# Altium project Main_Board.PrjPcb (part 5 of 44)

## Sheet System_CLK.SchDoc: Dystrybutory zegarów
size A3; Organization: Altium Limited; Address1: L3, 12a Rodborough Rd; Address2: Frenchs Forest; Address3: NSW; Address4: Australia 2086
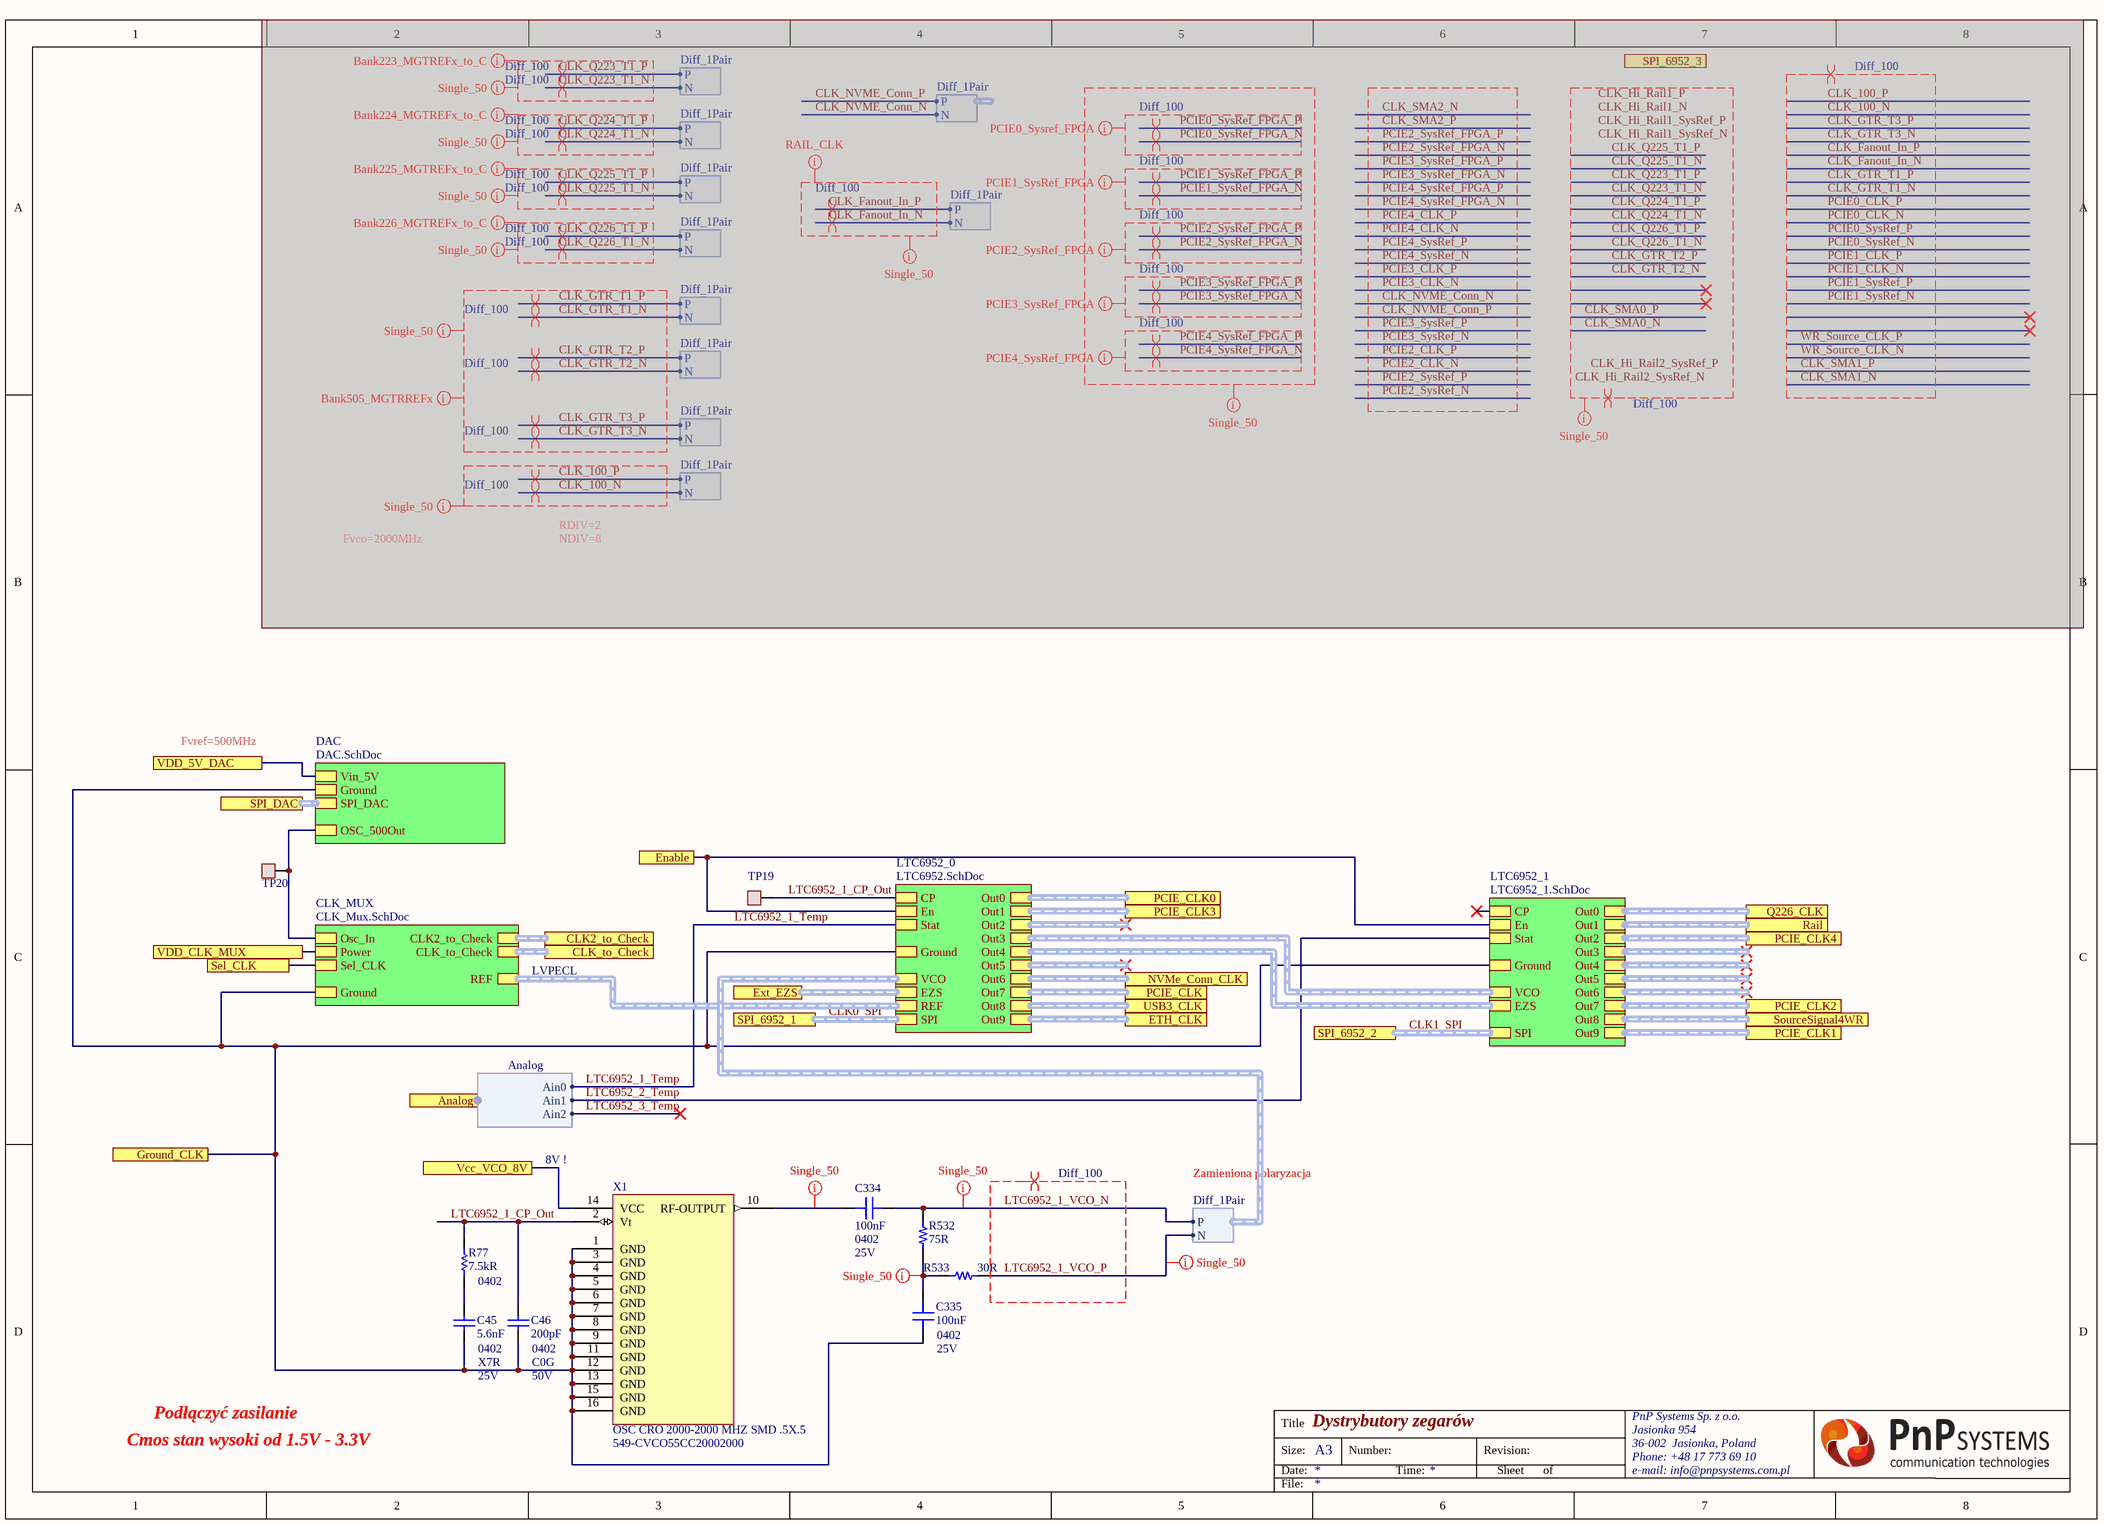
[diagram p5: System_CLK.SchDoc]

### Parts
C45  5.6nF  Case Code (Imperial): 0402  Voltage Rating: 25V  Dielectric: X7R  [CAP 0402/1005 KK]
C46  200pF  Case/Package: 0402  Voltage Rating: 50V  Dielectric: C0G  [CAP 0402/1005 KK]
C334  100nF  Case/Package: 0402  Voltage Rating: 25V  [CAP 0402/1005 KK]
C335  100nF  Case/Package: 0402  Voltage Rating: 25V  [CAP 0402/1005 KK]
R77  7.5kR  Case Code (Imperial): 0402  [RES 0402/1005 RF KK]
R532  75R  [RES 0402/1005 RF KK]
R533  30R  [RES 0402/1005 RF KK]
TP19  TestPoint  [TestPoint]  (value not drawn)
TP20  TestPoint  [TestPoint]  (value not drawn)
X1  OSC CRO 2000-2000 MHZ SMD .5X.5  Supplier Part Number 1: 549-CVCO55CC20002000  [CVCO55CW]

### Sub-sheets
CLK_MUX = CLK_Mux.SchDoc: Sel_CLK, REF (harness Diff_1Pair), Osc_In, Ground, Power, CLK_to_Check (harness Diff_1Pair), CLK2_to_Check (harness Diff_1Pair)
DAC = DAC.SchDoc: Vin_5V, SPI_DAC (harness SPI_H), Ground, OSC_500Out
LTC6952_0 = LTC6952.SchDoc: CP, Ground, Out6 (harness Diff_1Pair), VCO (harness Diff_1Pair), SPI (harness SPI_H), Stat, Out1 (harness Diff_1Pair), En, Out5 (harness Diff_1Pair), Out0 (harness Diff_1Pair), EZS (harness Diff_1Pair), Out2 (harness Diff_1Pair), Out7 (harness Diff_1Pair), REF (harness Diff_1Pair), Out8 (harness Diff_1Pair), Out3 (harness Diff_1Pair), Out4 (harness Diff_1Pair), Out9 (harness Diff_1Pair)
LTC6952_1 = LTC6952_1.SchDoc: EZS (harness Diff_1Pair), SPI (harness SPI_H), En, Out5 (harness Diff_1Pair), Ground, CP, Out4 (harness Diff_1Pair), Out6 (harness Diff_1Pair), VCO (harness Diff_1Pair), Out9 (harness Diff_1Pair), Stat, Out7 (harness Diff_1Pair), Out3 (harness Diff_1Pair), Out0 (harness Diff_1Pair), Out8 (harness Diff_1Pair), Out2 (harness Diff_1Pair), Out1 (harness Diff_1Pair)

### Ports
Analog (harness Analog), CLK2_to_Check (harness Diff_1Pair), CLK_to_Check (harness Diff_1Pair), Enable, ETH_CLK (harness Diff_1Pair), Ext_EZS (harness Diff_1Pair), Ground_CLK, NVMe_Conn_CLK (harness Diff_1Pair), PCIE_CLK0 (harness Diff_1Pair), PCIE_CLK1 (harness Diff_1Pair), PCIE_CLK2 (harness Diff_1Pair), PCIE_CLK3 (harness Diff_1Pair), PCIE_CLK4 (harness Diff_1Pair), PCIE_CLK (harness Diff_1Pair), Q226_CLK (harness Diff_1Pair), Rail (harness Diff_1Pair), Sel_CLK, SourceSignal4WR (harness Diff_1Pair), SPI_6952_1 (harness SPI_H), SPI_6952_2 (harness SPI_H), SPI_6952_3 (harness SPI_H), SPI_DAC (harness SPI_H), USB3_CLK (harness Diff_1Pair), Vcc_VCO_8V, VDD_5V_DAC, VDD_CLK_MUX

### Harnesses
Diff_1Pair: P, N
Analog: Ain0, Ain1, Ain2

### Nets
3V3_RAIL: port VDD_CLK_MUX, sheet CLK_MUX/Power
5V_LN: port VDD_5V_DAC, sheet DAC/Vin_5V
AGND: C45.1 C46.1 C335.1 X1.1(GND) X1.3(GND) X1.4(GND) X1.5(GND) X1.6(GND) X1.7(GND) X1.8(GND) X1.9(GND) X1.11(GND) X1.12(GND) X1.13(GND) X1.15(GND) X1.16(GND) ; port Ground_CLK, sheet DAC/Ground, sheet CLK_MUX/Ground, sheet LTC6952_1/Ground, sheet LTC6952_0/Ground
Enable_CLK: port Enable, sheet LTC6952_1/En, sheet LTC6952_0/En
LTC6952_1_CP_Out: C46.2 R77.2 TP19.1 X1.2(Vt) ; sheet LTC6952_0/CP
LTC6952_1_Temp: sheet LTC6952_0/Stat, port Analog.Ain0
LTC6952_1_VCO_N: C334.1 R532.2 ; sheet LTC6952_0/VCO.P
LTC6952_1_VCO_P: R533.2 ; sheet LTC6952_0/VCO.N
LTC6952_2_Temp: sheet LTC6952_1/Stat, port Analog.Ain1
OSC_500Out: TP20.1 ; sheet DAC/OSC_500Out, sheet CLK_MUX/Osc_In
SetClk_Si53323_2: port Sel_CLK, sheet CLK_MUX/Sel_CLK
NetC45_2: C45.2 R77.1
NetC334_2: C334.2 X1.10(RF-OUTPUT)
NetC335_2: C335.2 R532.1 R533.1
NetC713_2: X1.14(VCC) ; port Vcc_VCO_8V

### Buses and harness runs
harness CLK0_SPI = port SPI_6952_1 = sheet LTC6952_0/SPI
harness CLK1_SPI = port SPI_6952_2 = sheet LTC6952_1/SPI
harness port CLK2_to_Check = sheet CLK_MUX/CLK2_to_Check
harness port CLK_to_Check = sheet CLK_MUX/CLK_to_Check
harness port ETH_CLK = sheet LTC6952_0/Out9
harness port Ext_EZS = sheet LTC6952_0/EZS
harness port NVMe_Conn_CLK = sheet LTC6952_0/Out6
harness port PCIE_CLK0 = sheet LTC6952_0/Out0
harness port PCIE_CLK1 = sheet LTC6952_1/Out9
harness port PCIE_CLK2 = sheet LTC6952_1/Out7
harness port PCIE_CLK3 = sheet LTC6952_0/Out1
harness port PCIE_CLK4 = sheet LTC6952_1/Out2
harness port PCIE_CLK = sheet LTC6952_0/Out7
harness port Q226_CLK = sheet LTC6952_1/Out0
harness port Rail = sheet LTC6952_1/Out1
harness port SourceSignal4WR = sheet LTC6952_1/Out8
harness port SPI_DAC = sheet DAC/SPI_DAC
harness port USB3_CLK = sheet LTC6952_0/Out8
harness sheet CLK_MUX/REF = sheet LTC6952_0/REF
harness sheet LTC6952_0/Out3 = sheet LTC6952_1/VCO
harness sheet LTC6952_0/Out4 = sheet LTC6952_1/EZS

### Layout directives
net class Bank223_MGTREFx_to_C: CLK_Q223_T1_N, CLK_Q223_T1_P
net class Bank224_MGTREFx_to_C: CLK_Q224_T1_N, CLK_Q224_T1_P
net class Bank225_MGTREFx_to_C: CLK_Q225_T1_N, CLK_Q225_T1_P
net class Bank226_MGTREFx_to_C: CLK_Q226_T1_N, CLK_Q226_T1_P
differential pair; differential pair class Diff_100: CLK_100_N, CLK_100_P, CLK_Fanout_In_N, CLK_Fanout_In_P, CLK_GTR_T1_N, CLK_GTR_T1_P, CLK_GTR_T2_N, CLK_GTR_T2_P, CLK_GTR_T3_N, CLK_GTR_T3_P, CLK_Hi_Rail1_N, CLK_Hi_Rail1_P, CLK_Hi_Rail1_SysRef_N, CLK_Hi_Rail1_SysRef_P, CLK_Hi_Rail2_SysRef_N, CLK_Hi_Rail2_SysRef_P, CLK_Q223_T1_N, CLK_Q223_T1_P, CLK_Q224_T1_N, CLK_Q224_T1_P, CLK_Q225_T1_N, CLK_Q225_T1_P, CLK_Q226_T1_N, CLK_Q226_T1_P, CLK_SMA0_N, CLK_SMA0_P, CLK_SMA1_N, CLK_SMA1_P, LTC6952_1_VCO_N, LTC6952_1_VCO_P, PCIE0_CLK_N, PCIE0_CLK_P, PCIE0_SysRef_FPGA_N, PCIE0_SysRef_FPGA_P, PCIE0_SysRef_N, PCIE0_SysRef_P, PCIE1_CLK_N, PCIE1_CLK_P, PCIE1_SysRef_FPGA_N, PCIE1_SysRef_FPGA_P, PCIE1_SysRef_N, PCIE1_SysRef_P, PCIE2_SysRef_FPGA_N, PCIE2_SysRef_FPGA_P, PCIE3_SysRef_FPGA_N, PCIE3_SysRef_FPGA_P, PCIE4_SysRef_FPGA_N, PCIE4_SysRef_FPGA_P, WR_Source_CLK_N, WR_Source_CLK_P
net class Single_50: CLK_100_N, CLK_100_P, CLK_Fanout_In_N, CLK_Fanout_In_P, CLK_GTR_T1_N, CLK_GTR_T1_P, CLK_GTR_T2_N, CLK_GTR_T2_P, CLK_GTR_T3_N, CLK_GTR_T3_P, CLK_Hi_Rail1_N, CLK_Hi_Rail1_P, CLK_Hi_Rail1_SysRef_N, CLK_Hi_Rail1_SysRef_P, CLK_Hi_Rail2_SysRef_N, CLK_Hi_Rail2_SysRef_P, CLK_Q223_T1_N, CLK_Q223_T1_P, CLK_Q224_T1_N, CLK_Q224_T1_P, CLK_Q225_T1_N, CLK_Q225_T1_P, CLK_Q226_T1_N, CLK_Q226_T1_P, CLK_SMA0_N, CLK_SMA0_P, LTC6952_1_VCO_N, LTC6952_1_VCO_P, NetC334_2, NetC335_2, PCIE0_SysRef_FPGA_N, PCIE0_SysRef_FPGA_P, PCIE1_SysRef_FPGA_N, PCIE1_SysRef_FPGA_P, PCIE2_SysRef_FPGA_N, PCIE2_SysRef_FPGA_P, PCIE3_SysRef_FPGA_N, PCIE3_SysRef_FPGA_P, PCIE4_SysRef_FPGA_N, PCIE4_SysRef_FPGA_P
net class Bank505_MGTRREFx_: CLK_GTR_T1_N, CLK_GTR_T1_P, CLK_GTR_T2_N, CLK_GTR_T2_P, CLK_GTR_T3_N, CLK_GTR_T3_P
net class RAIL_CLK: CLK_Fanout_In_N, CLK_Fanout_In_P
net class PCIE0_Sysref_FPGA: PCIE0_SysRef_FPGA_N, PCIE0_SysRef_FPGA_P
net class PCIE1_SysRef_FPGA: PCIE1_SysRef_FPGA_N, PCIE1_SysRef_FPGA_P
net class PCIE2_SysRef_FPGA: PCIE2_SysRef_FPGA_N, PCIE2_SysRef_FPGA_P
net class PCIE3_SysRef_FPGA: PCIE3_SysRef_FPGA_N, PCIE3_SysRef_FPGA_P
net class PCIE4_SysRef_FPGA: PCIE4_SysRef_FPGA_N, PCIE4_SysRef_FPGA_P

### Notes on the sheet
- RDIV=2
- Fvco=2000MHz
- NDIV=8
- Fvref=500MHz
- LVPECL
- 8V !
- Zamieniona polaryzacja
- Cmos stan wysoki od 1.5V - 3.3V
- Podłączyć zasilanie
- Title
- Size:
- Date:
- A3
- Number:
- Time:
- Revision:
- Sheet
- of
- File:

### Library data of the parts
C45 = Capacitor: Cap Ceramic 0.0056uF 25V X7R 10% SMD 0402 125C Paper T/R; Manufacturer: Yageo; Manufacturer Part Number: CC0402KRX7R8BB562; Supplier 1: Digi-Key; Supplier Part Number 1: 311-1718-1-ND; RoHS: Yes; Category: Ceramic Capacitors; Stock 1: 38070; Pricing 1: 1=0,10000, 10=0,03300, 100=0,01470, 500=0,01050, 1000=0,00825, 2500=0,00750, 5000=0,00690 (USD); Mount: Surface Mount; Case/Package: 0402; Number of Pins: 2; Weight: 2.3E-05oz; Case Code (Metric): 1005; Min Operating Temperature: -55°C; Max Operating Temperature: 125°C; Capacitance: 5.6nF; Tolerance: 10%; Packaging: Tape and Reel; Voltage Rating (DC): 25V; Termination: SMD/SMT; Composition: Ceramic; Length: 0.039inch; Width: 0.02inch; Thickness: 0.022inch; Depth: 0.5mm; Lead Free: Lead Free; Halogen Free: Halogen Free; ComponentLink1URL: https://datasheet.ciiva.com/13264/upy-gphc-x7r-6-3v-to-50v-8-12304-13264955.pdf?src-supplier=Mouser; ComponentLink1Description: https://datasheet.ciiva.com/13264/upy-gphc-x7r-6-3v-to-50v-8-12304-13264955.pdf?src-supplier=Mouser
C46 = Capacitor: Multilayer Ceramic Capacitors MLCC - SMD/SMT 200pF 50V NPO 5%; Manufacturer: Yageo; Manufacturer Part Number: CC0402JRNPO9BN201; Supplier 1: Digi-Key; Supplier Part Number 1: 311-1664-1-ND; RoHS: Yes; Category: Ceramic Capacitors; Stock 1: 33907; Pricing 1: 1=0,12000, 10=0,08900, 100=0,04160, 500=0,02918, 1000=0,02416, 2500=0,02249, 5000=0,02058 (USD); Mount: Surface Mount; Case Code (Imperial): 0402; Case Code (Metric): 1005; Min Operating Temperature: -55°C; Max Operating Temperature: 125°C; Tolerance: 5%; Capacitance: 200pF; Packaging: Tape and Reel; Termination: SMD/SMT; Length: 0.039inch; Width: 0.02inch; Thickness: 0.022inch; Depth: 0.5mm; Lead Free: Lead Free; ComponentLink1URL: http://www.mouser.com/ds/2/447/Yageo_UPY-GP_NP0_16V-to-50V_9-358835.pdf?src-supplier=Mouser; ComponentLink1Description: http://www.mouser.com/ds/2/447/Yageo_UPY-GP_NP0_16V-to-50V_9-358835.pdf?src-supplier=Mouser; ComponentLink2URL: http://components.arrow.com/part/dataview/0323_00775856?src-supplier=Arrow+Europe; ComponentLink2Description: http://components.arrow.com/part/dataview/0323_00775856?src-supplier=Arrow+Europe; ComponentLink3URL: http://www.yageo.com/documents/recent/UPY-GP_NP0_16V-to-50V_9.pdf?src-supplier=Future+Electronics; ComponentLink3Description: http://www.yageo.com/documents/recent/UPY-GP_NP0_16V-to-50V_9.pdf?src-supplier=Future+Electronics; ComponentLink4URL: http://www.yageo.com/documents/recent/UPY-GP_NP0_16V-to-50V_16.pdf?src-supplier=Digi-Key; ComponentLink4Description: http://www.yageo.com/documents/recent/UPY-GP_NP0_16V-to-50V_16.pdf?src-supplier=Digi-Key; ComponentLink5URL: http://www.yageo.com/exep/pages/download/literatures/ProductSelectionGuide%202014_Final_2.pdf?src-supplier=Digi-Key; ComponentLink5Description: http://www.yageo.com/exep/pages/download/literatures/ProductSelectionGuide%202014_Final_2.pdf?src-supplier=Digi-Key
C334 C335 = Capacitor: as C588 on sheet WR_Clock; Supplier 1: Digi-Key; Supplier Part Number 1: 490-14603-1-ND; Stock 1: 89275; Pricing 1: 1 = 0,10000, 10 = 0,03400, 100 = 0,01520, 500 = 0,01088, 1000 = 0,00855, 2500 = 0,00778, 5000 = 0,00715 (USD); RoHS: Yes; Mount: Surface Mount; Weight: 0.000212oz; Case Code (Imperial): 0402; Case Code (Metric): 1005; Min Operating Temperature: -55°C; Max Operating Temperature: 125°C; Packaging: Tape and Reel; Capacitance: 100nF; Termination: SMD/SMT; Composition: Ceramic; Voltage Rating (DC): 25V; Package Quantity: 50000; Length: 0.039inch; Height: 0.5mm; Width: 0.5mm; Thickness: 0.022inch; ComponentLink1URL: http://www.mouser.com/ds/2/281/c02e-2905.pdf?src-supplier=Mouser; ComponentLink1Description: http://www.mouser.com/ds/2/281/c02e-2905.pdf?src-supplier=Mouser; ComponentLink2URL: http://search.murata.co.jp/Ceramy/image/img/A01X/G101/ENG/GRM155R71E104KE14-01.pdf?src-supplier=Digi-Key; ComponentLink2Description: http://search.murata.co.jp/Ceramy/image/img/A01X/G101/ENG/GRM155R71E104KE14-01.pdf?src-supplier=Digi-Key
R77 = Resistor: RES SMD 7.5K OHM 0.5% 1/16W 0402; Manufacturer: Susumu; Manufacturer Part Number: RR0510P-752-D; Power Rating: 62.5mW; Voltage Rating: 25V; Max Power Dissipation: 63mW; Temperature Coefficient: 25ppm/°C; Voltage Rating (DC): 50V; Supplier 1: Digi-Key; Supplier Part Number 1: RR05P7.5KDCT-ND; RoHS: Yes; Category: Chip SMD Resistors; Stock 1: 33319; Pricing 1: 1=0,10000, 10=0,07400, 100=0,02850, 1000=0,01254, 2500=0,01083, 5000=0,00969 (USD); Case/Package: 0402; Case Code (Metric): 1005; Min Operating Temperature: -55°C; Max Operating Temperature: 125°C; Package Quantity: 1; Resistance: 7.5kR; Tolerance: 0.5%; Packaging: Tape and Reel; Composition: Thin Film; Number of Terminations: 2; Termination: SMD/SMT; Length: 0.039inch; Height: 0.016inch; Width: 0.02inch; Lead Free: Lead Free; ComponentLink1URL: https://datasheet.ciiva.com/2525/rr-data-sheet-2525152.pdf?src-supplier=Digi-Key; ComponentLink1Description: https://datasheet.ciiva.com/2525/rr-data-sheet-2525152.pdf?src-supplier=Digi-Key; ComponentLink2URL: https://datasheet.ciiva.com/2525/rr-data-sheet-2525153.pdf?src-supplier=Digi-Key; ComponentLink2Description: https://datasheet.ciiva.com/2525/rr-data-sheet-2525153.pdf?src-supplier=Digi-Key; ComponentLink3URL: https://datasheet.ciiva.com/2525/rr-data-sheet-2525154.pdf?src-supplier=Digi-Key; ComponentLink3Description: https://datasheet.ciiva.com/2525/rr-data-sheet-2525154.pdf?src-supplier=Digi-Key
R532 = Resistor: Res Thick Film 0402 75 Ohm 1% 1/10W 100ppm/C Molded SMD SMD Punched Carrier T/R; Manufacturer: Panasonic; Manufacturer Part Number: ERJ-2RKF75R0X; Voltage Rating: 50V; Power Rating: 100mW; Temperature Coefficient: 100ppm/°C; Supplier 1: Digi-Key; Supplier Part Number 1: P75.0LDKR-ND; RoHS: Yes; Category: Chip SMD Resistors; Stock 1: 1175660; Pricing 1: 1=0,10000, 10=0,04000, 100=0,01620, 1000=0,00729, 2500=0,00632, 5000=0,00523 (USD); Mount: Surface Mount; Case/Package: 0402; Case Code (Metric): 1005; Case Code (Imperial): 0402; Contact Plating: Tin; Min Operating Temperature: -55°C; Max Operating Temperature: 155°C; Tolerance: 1%; Packaging: Tape and Reel; Resistance: 75R; Package Quantity: 1; Composition: Thick Film; Number of Terminations: 2; Termination: SMD/SMT; Military Standard: Not; Max Power Dissipation: 100mW; Voltage Rating (DC): 50V; Features: Automotive AEC-Q200; Length: 1mm; Height: 0.35mm; Width: 0.02inch; Depth: 0.5mm; Radiation Hardening: No; REACH SVHC: No SVHC; Lead Free: Lead Free; ComponentLink1URL: https://datasheet.ciiva.com/11821/0900766b80f80784-11821360.pdf?src-supplier=RSComponents; ComponentLink1Description: https://datasheet.ciiva.com/11821/0900766b80f80784-11821360.pdf?src-supplier=RSComponents; ComponentLink2URL: https://datasheet.ciiva.com/30254/aoa0000ce2-30254694.pdf?src-supplier=Onlinecomponents.com; ComponentLink2Description: https://datasheet.ciiva.com/30254/aoa0000ce2-30254694.pdf?src-supplier=Onlinecomponents.com; ComponentLink3URL: https://datasheet.ciiva.com/43460/426256-43460278.pdf?src-supplier=Farnell; ComponentLink3Description: https://datasheet.ciiva.com/43460/426256-43460278.pdf?src-supplier=Farnell; ComponentLink4URL: https://datasheet.ciiva.com/16777/70260748-16777802.pdf?src-supplier=Allied+Electronics; ComponentLink4Description: https://datasheet.ciiva.com/16777/70260748-16777802.pdf?src-supplier=Allied+Electronics; ComponentLink5URL: https://datasheet.ciiva.com/24071/aoa0000ce2-24071598.pdf?src-supplier=Mouser; ComponentLink5Description: https://datasheet.ciiva.com/24071/aoa0000ce2-24071598.pdf?src-supplier=Mouser; ComponentLink6URL: https://datasheet.ciiva.com/16772/70260748-16772175.pdf?src-supplier=Allied+Electronics; ComponentLink6Description: https://datasheet.ciiva.com/16772/70260748-16772175.pdf?src-supplier=Allied+Electronics; ComponentLink7URL: https://datasheet.ciiva.com/46377/426256-46377007.pdf?src-supplier=Element14; ComponentLink7Description: https://datasheet.ciiva.com/46377/426256-46377007.pdf?src-supplier=Element14; ComponentLink8URL: https://datasheet.ciiva.com/48531/aoa0000ce2-48531055.pdf?src-supplier=Avnet; ComponentLink8Description: https://datasheet.ciiva.com/48531/aoa0000ce2-48531055.pdf?src-supplier=Avnet; ComponentLink9URL: https://datasheet.ciiva.com/5917/426256-5917818.pdf?src-supplier=Farnell; ComponentLink9Description: https://datasheet.ciiva.com/5917/426256-5917818.pdf?src-supplier=Farnell; ComponentLink10URL: https://datasheet.ciiva.com/46388/426256-46388476.pdf?src-supplier=Element14; ComponentLink10Description: https://datasheet.ciiva.com/46388/426256-46388476.pdf?src-supplier=Element14; ComponentLink11URL: https://datasheet.ciiva.com/9187/aoa0000ce2-9187662.pdf?src-supplier=Avnet; ComponentLink11Description: https://datasheet.ciiva.com/9187/aoa0000ce2-9187662.pdf?src-supplier=Avnet
R533 = Resistor: RES SMD 30 OHM 0.5% 1/16W 0402; Manufacturer: Panasonic; Manufacturer Part Number: ERA-2AKD300X; Power Rating: 62.5mW; Temperature Coefficient: 100ppm/°C; Max Power Dissipation: 63mW; Supplier 1: Digi-Key; Supplier Part Number 1: P30DDCT-ND; RoHS: Yes; Category: Chip SMD Resistors; Stock 1: 32301; Pricing 1: 1=0,10000, 10=0,07500, 100=0,03070, 1000=0,01377, 2500=0,01196, 5000=0,00988 (USD); Mount: Surface Mount; Case/Package: 0402; Case Code (Metric): 1005; Case Code (Imperial): 0402; Contact Plating: Tin; Min Operating Temperature: -55°C; Max Operating Temperature: 155°C; Resistance: 30R; Tolerance: 0.5%; Packaging: Tape and Reel; Package Quantity: 10000; Composition: Thin Film; Number of Terminations: 2; Length: 0.039inch; Height: 0.016inch; Width: 0.02inch; Lead Free: Lead Free; ComponentLink1URL: https://media.digikey.com/pdf/Data%20Sheets/Panasonic%20Resistors%20Thermistors%20PDFs/ERA_Series_LE.pdf?src-supplier=Digi-Key; ComponentLink1Description: https://media.digikey.com/pdf/Data%20Sheets/Panasonic%20Resistors%20Thermistors%20PDFs/ERA_Series_LE.pdf?src-supplier=Digi-Key; ComponentLink2URL: http://www.mouser.com/ds/2/315/AOA0000CE26-32660.pdf?src-supplier=Mouser; ComponentLink2Description: http://www.mouser.com/ds/2/315/AOA0000CE26-32660.pdf?src-supplier=Mouser; ComponentLink3URL: http://industrial.panasonic.com/www-data/pdf/AOA0000/AOA0000CE26.pdf?src-supplier=Avnet; ComponentLink3Description: http://industrial.panasonic.com/www-data/pdf/AOA0000/AOA0000CE26.pdf?src-supplier=Avnet; ComponentLink4URL: https://industrial.panasonic.com/cdbs/www-data/pdf/RDM0000/AOA0000C307.pdf?src-supplier=Digi-Key; ComponentLink4Description: https://industrial.panasonic.com/cdbs/www-data/pdf/RDM0000/AOA0000C307.pdf?src-supplier=Digi-Key
TP19 TP20 = TestPoint: Manufacturer: Keystone Electronics; Manufacturer Part Number: 5001; Plating: Silver; Body Material: PBT,Bronze; Number of Ports: 1; Insulation: Insulated; Inside Diameter: 1.27mm; Outside Diameter: 2.54mm; Hole Diameter: 1.6mm; Supplier 1: Digi-Key; Stock 1: 352180; Pricing 1: 1 = 0,35000, 10 = 0,33500, 25 = 0,30800, 100 = 0,30150, 250 = 0,28304, 500 = 0,25230, 1000 = 0,17140, 2500 = 0,15296, 5000 = 0,14340 (USD); RoHS: Yes; Mount: Through Hole,PCB; Color: Black; Contact Material: Bronze; Contact Plating: Silver,Tin; Material: Nylon,Bronze,Silver; Housing Color: Black; Packaging: Bulk; Package Quantity: 100; Termination: Through Hole; Number of Contacts: 1; Orientation: Straight; Diameter: 2.54mm; Length: 7.62mm; Height: 0.3inch; Lead Free: Lead Free; REACH SVHC: No SVHC; Flammability Rating: UL94 V-0; ComponentLink1URL: https://datasheet.ciiva.com/27052/1581986-27052611.pdf?src-supplier=Jameco; ComponentLink1Description: https://datasheet.ciiva.com/27052/1581986-27052611.pdf?src-supplier=Jameco; ComponentLink2URL: https://datasheet.ciiva.com/11836/0900766b8009b7c7-11836045.pdf?src-supplier=RSComponents; ComponentLink2Description: https://datasheet.ciiva.com/11836/0900766b8009b7c7-11836045.pdf?src-supplier=RSComponents; ComponentLink3URL: https://datasheet.ciiva.com/22631/1703983-22631100.pdf?src-supplier=Element14; ComponentLink3Description: https://datasheet.ciiva.com/22631/1703983-22631100.pdf?src-supplier=Element14; ComponentLink4URL: https://datasheet.ciiva.com/16318/m60-2p60-16318423.pdf?src-supplier=Future+Electronics; ComponentLink4Description: https://datasheet.ciiva.com/16318/m60-2p60-16318423.pdf?src-supplier=Future+Electronics; Supplier Part Number 1: 36-5001-ND
X1 = CVCO55CC-2000-2000: Manufacturer: Crystek; Frequency: 2GHz; Load Capacitance: 22pF; Operating Supply Voltage: 8V; Supplier 1: Mouser; Manufacturer Part Number: CVCO55CC-2000-2000; Stock 1: 18; Pricing 1: 1 = 32,65000, 5 = 31,16000, 10 = 28,20000, 25 = 26,71000, 50 = 25,23000, 100 = 22,26000 (USD); RoHS: Yes; Min Operating Temperature: -30°C; Max Operating Temperature: 85°C; Packaging: Cut Tape; Package Quantity: 1; Termination: SMD/SMT; Length: 0.5inch; Height: 0.22inch; Width: 0.5inch; ComponentLink1URL: https://datasheet.ciiva.com/12380/cvco55cc-2000-2000-218619-12380053.pdf?src-supplier=Mouser; ComponentLink1Description: https://datasheet.ciiva.com/12380/cvco55cc-2000-2000-218619-12380053.pdf?src-supplier=Mouser; ComponentLink2URL: https://datasheet.ciiva.com/6719/cvco55cc-2000-2000-6719815.pdf?src-supplier=Digi-Key; ComponentLink2Description: https://datasheet.ciiva.com/6719/cvco55cc-2000-2000-6719815.pdf?src-supplier=Digi-Key

## Sheet DAC.SchDoc: DAC
size A4; Organization: Altium Limited; Address1: L3, 12a Rodborough Rd; Address2: Frenchs Forest; Address3: NSW; Address4: Australia 2086
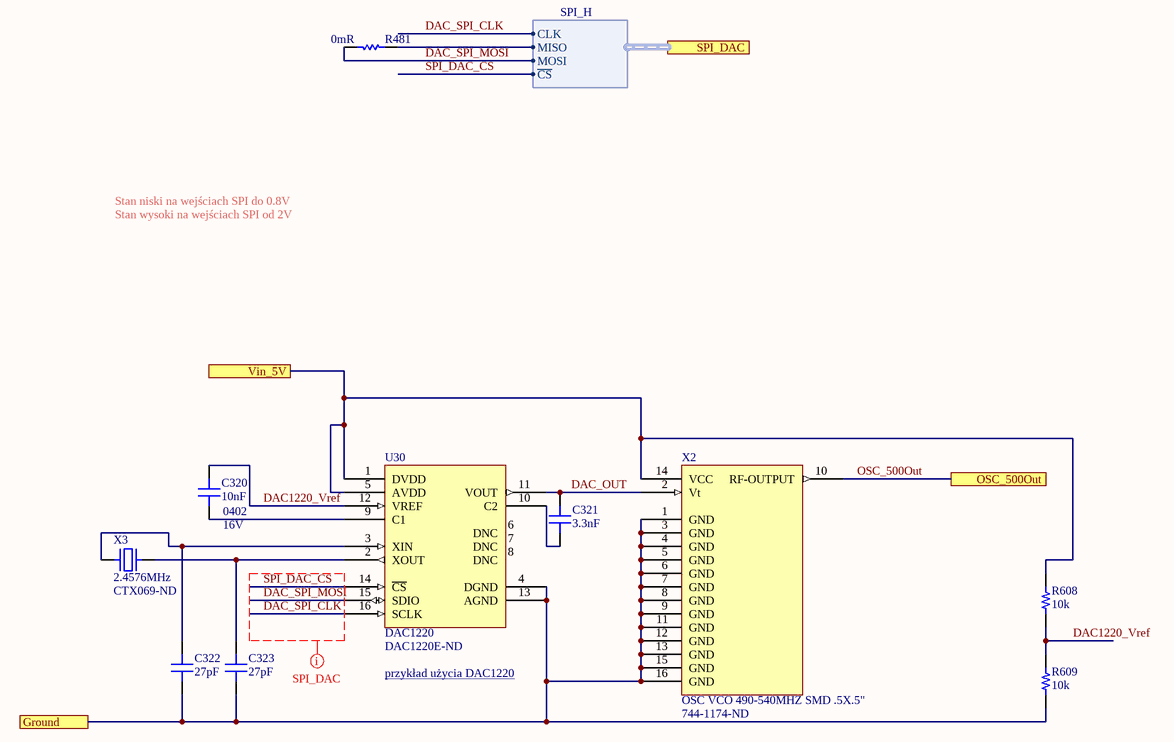
[diagram p6: DAC.SchDoc]

### Parts
C320  10nF  Case/Package: 0402  Voltage Rating (DC): 16V  [CAP 0402/1005 KK]
C321  3.3nF  [CAP 0603/1608 RF]
C322  27pF  [CAP 0402/1005 KK]
C323  27pF  [CAP 0402/1005 KK]
R481  0mR  [RES 0402/1005 RF KK]
R608  10k  [RES 0402/1005 RF KK]
R609  10k  [RES 0402/1005 RF KK]
U30  DAC1220  Supplier Part Number 1: DAC1220E-ND  [DAC1220]
X2  OSC VCO 490-540MHZ SMD .5X.5"  Supplier Part Number 1: 744-1174-ND  [CVCO55CW]
X3  2.4576MHz  Supplier Part Number 1: CTX069-ND  [Crystal]

### Ports
Ground, OSC_500Out, SPI_DAC (harness SPI_H), Vin_5V

### Harnesses
SPI_H: CLK, MISO, MOSI, ~{CS}

### Nets
5V_LN: R608.1 U30.1(DVDD) U30.5(AVDD) X2.14(VCC) ; port Vin_5V
AGND: C322.1 C323.1 R609.2 U30.4(DGND) U30.13(AGND) X2.1(GND) X2.3(GND) X2.4(GND) X2.5(GND) X2.6(GND) X2.7(GND) X2.8(GND) X2.9(GND) X2.11(GND) X2.12(GND) X2.13(GND) X2.15(GND) X2.16(GND) ; port Ground
DAC1220_Vref: C320.1 R608.2 R609.1 U30.12(VREF)
DAC_OUT: C321.2 U30.11(VOUT) X2.2(Vt)
DAC_SPI_CLK: U30.16(SCLK) ; port SPI_DAC.CLK
DAC_SPI_MOSI: R481.1 U30.15(SDIO) ; port SPI_DAC.MOSI
OSC_500Out: X2.10(RF-OUTPUT) ; port OSC_500Out
SPI_DAC_CS: U30.14(~{CS}) ; port SPI_DAC.~{CS}
NetC320_2: C320.2 U30.9(C1)
NetC321_1: C321.1 U30.10(C2)
NetC322_2: C322.2 U30.3(XIN) X3.1
NetC323_2: C323.2 U30.2(XOUT) X3.2
NetR481_2: R481.2 ; port SPI_DAC.MISO

Not connected (* = marked no-connect by the designer): U30 6(DNC) 7(DNC) 8(DNC)

### Layout directives
net class SPI_DAC: DAC_SPI_CLK, DAC_SPI_MOSI, SPI_DAC_CS

### Notes on the sheet
- Stan niski na wejściach SPI do 0.8V
- Stan wysoki na wejściach SPI od 2V
- przykład użycia DAC1220 <http://www.ti.com/lit/ug/sbau102/sbau102.pdf>
- Title
- Size:
- Date:
- A3
- Number:
- Time:
- Revision:
- Sheet
- of
- File:

### Library data of the parts
C320 = Capacitor: Manufacturer: KEMET; Manufacturer Part Number: C0402C103K4RACTU; Dielectric Material: Ceramic; Tolerance: 10%; Dielectric: X7R; Dissipation Factor: 3.5%; Supplier 1: Digi-Key; Supplier Part Number 1: 399-1038-1-ND; Stock 1: 1112674; Pricing 1: 1 = 0,10000, 10 = 0,02800, 100 = 0,01240, 500 = 0,00886, 1000 = 0,00696, 2500 = 0,00632, 5000 = 0,00582 (USD); RoHS: Yes; Mount: Surface Mount,PCB; Number of Pins: 2; Case Code (Metric): 1005; Case Code (Imperial): 0402; Contact Plating: Tin,Matte; Min Operating Temperature: -55°C; Max Operating Temperature: 125°C; Capacitance: 10nF; Packaging: Tape and Reel; Package Quantity: 1; Voltage Rating: 16V; Termination: SMD/SMT; Voltage: 16V; Length: 1mm; Height: 0.5mm; Width: 0.02inch; Depth: 0.5mm; Thickness: 0.022inch; Lead Pitch: 0.3mm; Radiation Hardening: No; REACH SVHC: No SVHC; ComponentLink1URL: https://datasheet.ciiva.com/14595/70095383-14595321.pdf?src-supplier=Allied+Electronics; ComponentLink1Description: https://datasheet.ciiva.com/14595/70095383-14595321.pdf?src-supplier=Allied+Electronics; ComponentLink2URL: https://datasheet.ciiva.com/7747/kem-c1002-x7r-smd-7747614.pdf?src-supplier=Element14; ComponentLink2Description: https://datasheet.ciiva.com/7747/kem-c1002-x7r-smd-7747614.pdf?src-supplier=Element14
C321 = Capacitor: Manufacturer: Wurth Electronics; Manufacturer Part Number: 885012006016; Voltage Rating: 10V; Tolerance: 5%; Supplier 1: Digi-Key; Supplier Part Number 1: 732-7759-1-ND; Stock 1: 3926; Pricing 1: 1 = 0,10000, 10 = 0,08500, 100 = 0,07590, 500 = 0,06712 (USD); RoHS: Yes; Mount: Surface Mount; Case/Package: 0603; Case Code (Metric): 1608; Case Code (Imperial): 0603; Min Operating Temperature: -55°C; Max Operating Temperature: 125°C; Packaging: Tape and Reel; Capacitance: 3.3nF; Length: 0.063inch; Width: 0.031inch; Thickness: 0.034inch; ComponentLink1URL: https://katalog.we-online.de/pbs/datasheet/885012006016.pdf?src-supplier=Digi-Key; ComponentLink1Description: https://katalog.we-online.de/pbs/datasheet/885012006016.pdf?src-supplier=Digi-Key
C322 C323 = Capacitor: Manufacturer: KEMET; Manufacturer Part Number: C0402C270K5GACTU; Dielectric Material: Ceramic; Tolerance: 10%; Voltage Rating (DC): 50V; Dielectric: C0G; Supplier 1: Digi-Key; Supplier Part Number 1: 399-8960-1-ND; Stock 1: 1014365; Pricing 1: 1 = 0,10000, 10 = 0,02000, 100 = 0,00900, 500 = 0,00644, 1000 = 0,00506, 2500 = 0,00460, 5000 = 0,00423 (USD); RoHS: Yes; Mount: Surface Mount; Case/Package: 0402; Case Code (Metric): 1005; Case Code (Imperial): 0402; Min Operating Temperature: -55°C; Max Operating Temperature: 125°C; Capacitance: 27pF; Packaging: Tape and Reel; Package Quantity: 1; Voltage Rating: 50V; Termination: SMD/SMT; Length: 1mm; Height: 0.5mm; Depth: 0.5mm; Width: 0.02inch; Thickness: 0.022inch; Lead Pitch: 0.3mm; Lead Free: Lead Free; ComponentLink1URL: https://datasheet.ciiva.com/5413/kem-c1003-c0g-smd-5413929.pdf?src-supplier=Mouser; ComponentLink1Description: https://datasheet.ciiva.com/5413/kem-c1003-c0g-smd-5413929.pdf?src-supplier=Mouser
R481 = Resistor: as R1095 on sheet LED_US_1; Supplier 1: Digi-Key; Supplier Part Number 1: 311-0.0JRCT-ND; Stock 1: 69822252; Pricing 1: 1=0.10000, 10=0.01200, 25=0.00920, 50=0.00680, 100=0.00510, 250=0.00388, 500=0.00308, 1000=0.00227, 5000=0.00163 (USD); RoHS: Yes; Case/Package: 0402; Contact Plating: Tin,Matte; Case Code (Metric): 1005; Case Code (Imperial): 0402; Min Operating Temperature: -55°C; Max Operating Temperature: 155°C; Resistance: 0mR; Packaging: Tape and Reel; Composition: Thick Film; Package Quantity: 1; Number of Terminations: 2; Termination: SMD/SMT; Military Standard: Not; Features: Moisture Resistant; Length: 1mm; Height: 0.016inch; Width: 0.02inch; Depth: 0.5mm; Radiation Hardening: No; REACH SVHC: Unknown; Lead Free: Lead Free; ComponentLink1URL: https://datasheet.ciiva.com/2452/pyu-rc0402-51-rohs-l-6-2452608.pdf?src-supplier=Digi-Key; ComponentLink1Description: https://datasheet.ciiva.com/2452/pyu-rc0402-51-rohs-l-6-2452608.pdf?src-supplier=Digi-Key; ComponentLink2URL: https://datasheet.ciiva.com/11808/0900766b80c66297-11808195.pdf?src-supplier=RSComponents; ComponentLink2Description: https://datasheet.ciiva.com/11808/0900766b80c66297-11808195.pdf?src-supplier=RSComponents; ComponentLink3URL: https://datasheet.ciiva.com/2452/pyu-r-int-thick-7-2452609.pdf?src-supplier=Digi-Key; ComponentLink3Description: https://datasheet.ciiva.com/2452/pyu-r-int-thick-7-2452609.pdf?src-supplier=Digi-Key; ComponentLink4URL: https://datasheet.ciiva.com/22747/1018594-22747515.pdf?src-supplier=Element14; ComponentLink4Description: https://datasheet.ciiva.com/22747/1018594-22747515.pdf?src-supplier=Element14; ComponentLink5URL: https://datasheet.ciiva.com/7983/1018594-7983535.pdf?src-supplier=Element14; ComponentLink5Description: https://datasheet.ciiva.com/7983/1018594-7983535.pdf?src-supplier=Element14; ComponentLink6URL: https://datasheet.ciiva.com/2452/pyu-r-int-thick-7-2452610.pdf?src-supplier=Digi-Key; ComponentLink6Description: https://datasheet.ciiva.com/2452/pyu-r-int-thick-7-2452610.pdf?src-supplier=Digi-Key; ComponentLink7URL: https://datasheet.ciiva.com/8896/pyu-rc0402-51-rohs-l-6-8896201.pdf?src-supplier=Avnet; ComponentLink7Description: https://datasheet.ciiva.com/8896/pyu-rc0402-51-rohs-l-6-8896201.pdf?src-supplier=Avnet; ComponentLink8URL: https://datasheet.ciiva.com/28386/pyu-rc0402-51-rohs-l-6-28386633.pdf?src-supplier=Avnet+Europe; ComponentLink8Description: https://datasheet.ciiva.com/28386/pyu-rc0402-51-rohs-l-6-28386633.pdf?src-supplier=Avnet+Europe; ComponentLink9URL: https://datasheet.ciiva.com/15189/getdatasheetpartid-326379-15189533.pdf?src-supplier=Verical; ComponentLink9Description: https://datasheet.ciiva.com/15189/getdatasheetpartid-326379-15189533.pdf?src-supplier=Verical
R608 R609 = Resistor: SMT Resistor; Value: 10k; Part Number: *; Supplier 1: Digi-Key; Supplier Part Number 1: RR05P10.0KDCT-ND
U30 = DAC1220: DAC 20bit; Manufacturer: Texas Instruments; Manufacturer Part Number: DAC1220E; Number of Bits: 20; Operating Supply Voltage: 5V; Interface: SPI; Resolution: 20b; Sampling Rate: 500S/s; Number of Channels: 1; Settling Time: 2000us; Output Type: Voltage; Max Supply Voltage: 5.25V; Min Supply Voltage: 4.75V; Power Consumption: 2.5mW; Nominal Supply Current: 460uA; Supply Type: Analog,Digital; Integral Nonlinearity (INL): 1LSB; Full Scale Error: 10LSB; Polarity: Unipolar; Supplier 1: Digi-Key; Stock 1: 237; Pricing 1: 1 = 19,80000, 10 = 18,19400, 25 = 17,44000, 100 = 15,36600, 500 = 13,66916 (USD); RoHS: Yes; Case/Package: SSOP; Number of Pins: 16; Weight: 0.002603oz; Contact Plating: Gold; Min Operating Temperature: -40°C; Max Operating Temperature: 85°C; Packaging: Rail/Tube; Package Quantity: 75; Number of Converters: 1; Conversion Rate: 500S/s; Number of DAC Channels: 1; Differential Nonlinearity: 1LSB; Length: 5mm; Height: 1.5mm; Width: 4mm; Radiation Hardening: No; Lead Free: Lead Free; REACH SVHC: No SVHC; ComponentLink1URL: https://datasheet.ciiva.com/1494/1762528-1494337.pdf?src-supplier=Element14; ComponentLink1Description: https://datasheet.ciiva.com/1494/1762528-1494337.pdf?src-supplier=Element14; ComponentLink2URL: https://datasheet.ciiva.com/25983/sbas082g-25983810.pdf?src-supplier=Avnet+Europe; ComponentLink2Description: https://datasheet.ciiva.com/25983/sbas082g-25983810.pdf?src-supplier=Avnet+Europe; ComponentLink3URL: https://datasheet.ciiva.com/14152/uz642298-e-14152445.pdf?src-supplier=Distrelec; ComponentLink3Description: https://datasheet.ciiva.com/14152/uz642298-e-14152445.pdf?src-supplier=Distrelec; ComponentLink4URL: https://datasheet.ciiva.com/26804/dac1220e-26804784.pdf?src-supplier=IIIC; ComponentLink4Description: https://datasheet.ciiva.com/26804/dac1220e-26804784.pdf?src-supplier=IIIC; ComponentLink5URL: https://datasheet.ciiva.com/15146/getdatasheetpartid-224186-15146981.pdf?src-supplier=Verical; ComponentLink5Description: https://datasheet.ciiva.com/15146/getdatasheetpartid-224186-15146981.pdf?src-supplier=Verical; ComponentLink6URL: https://datasheet.ciiva.com/3040/sbas082g-3040444.pdf?src-supplier=Avnet; ComponentLink6Description: https://datasheet.ciiva.com/3040/sbas082g-3040444.pdf?src-supplier=Avnet; ComponentLink7URL: https://datasheet.ciiva.com/1364/dac1220-1364430.pdf?src-supplier=Digi-Key; ComponentLink7Description: https://datasheet.ciiva.com/1364/dac1220-1364430.pdf?src-supplier=Digi-Key
X2 = CVCO55CL-0490-0540: Manufacturer: Crystek; Frequency: 540MHz; Load Capacitance: 100pF; Max Supply Voltage: 5.25V; Min Supply Voltage: 4.75V; Supplier 1: Digi-Key; Manufacturer Part Number: CVCO55CL-0490-0540; Stock 1: 6; Pricing 1: 1 = 24,31000, 5 = 23,20600, 10 = 20,99500, 25 = 19,89000, 50 = 18,78500 (USD); RoHS: Yes; Mount: Surface Mount; Case/Package: SMD/SMT; Number of Pins: 16; Min Operating Temperature: -40°C; Max Operating Temperature: 85°C; Package Quantity: 5; Packaging: Cut Tape; Termination: SMD/SMT; Length: 0.5inch; Height: 0.15inch; Width: 0.5inch; ComponentLink1URL: https://datasheet.ciiva.com/884/cvco55cl-0490-0540-884171.pdf?src-supplier=Digi-Key; ComponentLink1Description: https://datasheet.ciiva.com/884/cvco55cl-0490-0540-884171.pdf?src-supplier=Digi-Key; ComponentLink2URL: https://datasheet.ciiva.com/12381/cvco55cl-0490-0540-32994-12381581.pdf?src-supplier=Mouser; ComponentLink2Description: https://datasheet.ciiva.com/12381/cvco55cl-0490-0540-32994-12381581.pdf?src-supplier=Mouser; ComponentLink3URL: https://datasheet.ciiva.com/14620/70051761-14620845.pdf?src-supplier=Allied+Electronics; ComponentLink3Description: https://datasheet.ciiva.com/14620/70051761-14620845.pdf?src-supplier=Allied+Electronics
X3 = MP024S: CRYSTAL 2.4576MHZ 32PF T/H; Manufacturer: CTS; Frequency Tolerance: 30ppm; Frequency Stability: 50ppm; ESR (Equivalent Series Resistance): 300R; Supplier 1: Digi-Key; Manufacturer Part Number: MP024S; Stock 1: 2166; Pricing 1: 1 = 1,14000, 10 = 1,08500, 50 = 1,05980, 100 = 0,90850, 500 = 0,88322, 1000 = 0,74443, 2500 = 0,70658, 5000 = 0,68135, 10000 = 0,65611 (USD); RoHS: Yes; Mount: Through Hole; Number of Pins: 2; Min Operating Temperature: -20°C; Max Operating Temperature: 70°C; Packaging: Bulk; Load Capacitance: 32pF; Frequency: 2.4576MHz; Package Quantity: 100; Tolerance: 30ppm; Termination: Radial; Series Resistance: 300R; Length: 10.85mm; Height: 0.53inch; Width: 0.15inch; Depth: 3.8mm; Radiation Hardening: No; Lead Free: Lead Free; ComponentLink1URL: https://datasheet.ciiva.com/27056/2039161-27056418.pdf?src-supplier=Jameco; ComponentLink1Description: https://datasheet.ciiva.com/27056/2039161-27056418.pdf?src-supplier=Jameco; ComponentLink2URL: https://datasheet.ciiva.com/15116/getdatasheetpartid-123295-15116382.pdf?src-supplier=Verical; ComponentLink2Description: https://datasheet.ciiva.com/15116/getdatasheetpartid-123295-15116382.pdf?src-supplier=Verical; ComponentLink3URL: https://datasheet.ciiva.com/854/008-0308-0-854108.pdf?src-supplier=Digi-Key; ComponentLink3Description: https://datasheet.ciiva.com/854/008-0308-0-854108.pdf?src-supplier=Digi-Key

## Sheet CLK_Mux.SchDoc: Selektor zegarów
size A3; Organization: Altium Limited; Address1: L3, 12a Rodborough Rd; Address2: Frenchs Forest; Address3: NSW; Address4: Australia 2086
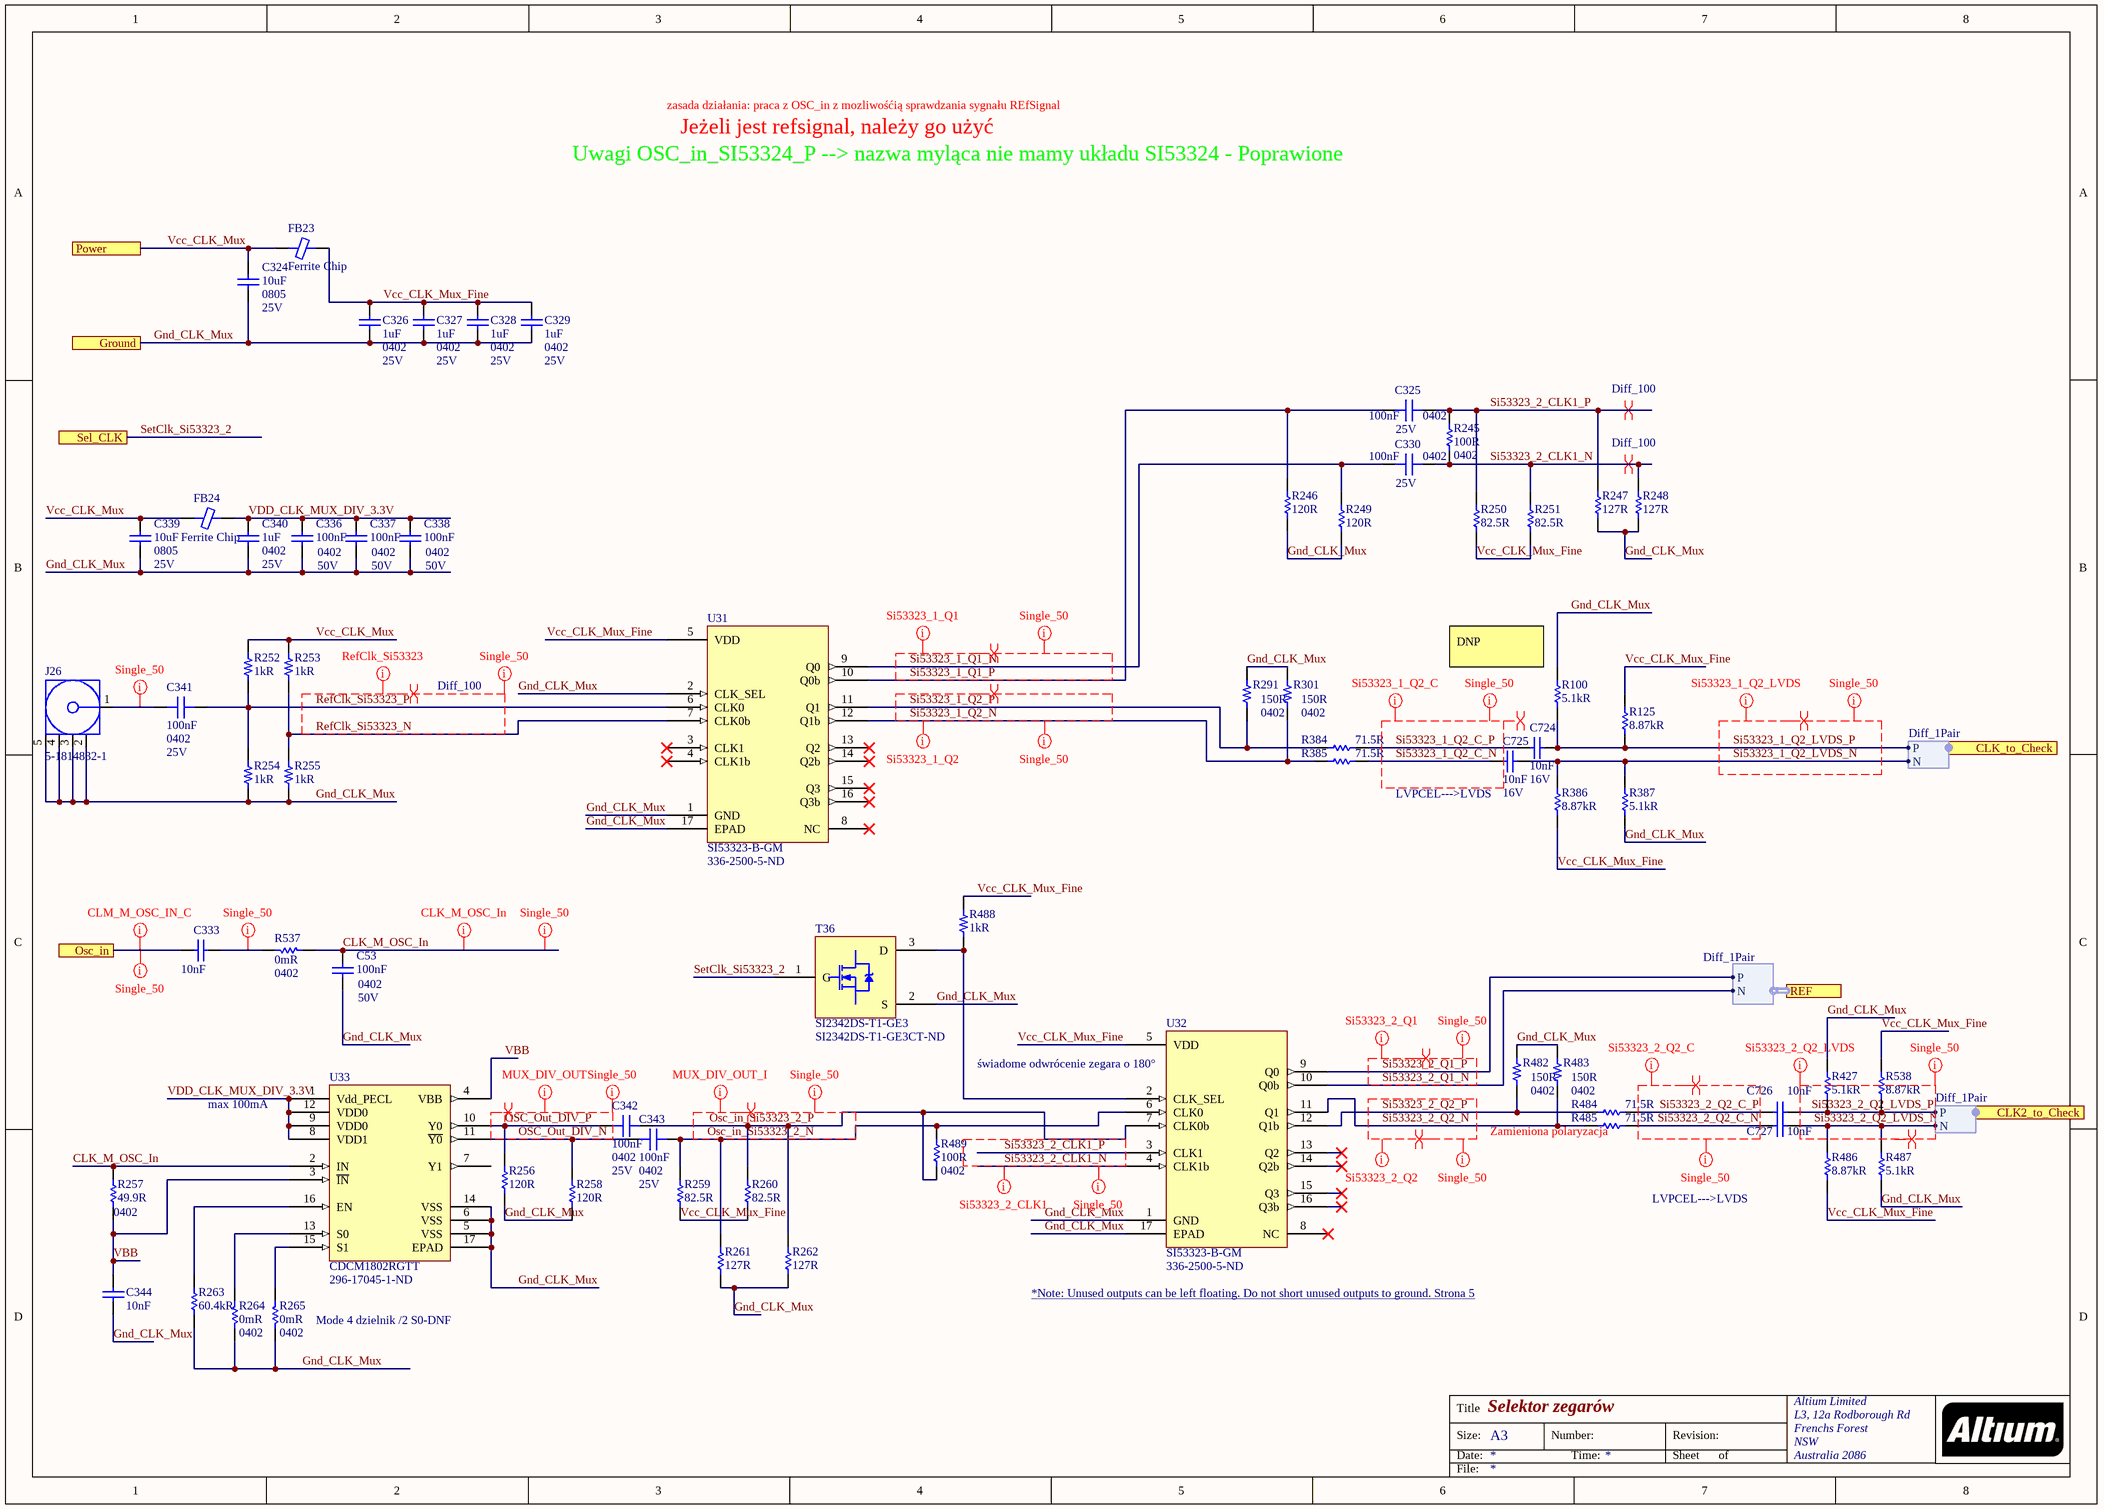
[diagram p7: CLK_Mux.SchDoc]

### Parts
C53  100nF  Case Code (Imperial): 0402  Voltage: 50V  [CAP 0402/1005 KK]
C324  10uF  Case/Package: 0805  Voltage Rating: 25V  [CAP 0805/2012 RF]
C325  100nF  Case/Package: 0402  Voltage Rating: 25V  [CAP 0402/1005 KK]
C326  1uF  Case/Package: 0402  Voltage Rating: 25V  [CAP 0402/1005 KK]
C327  1uF  Case/Package: 0402  Voltage Rating: 25V  [CAP 0402/1005 KK]
C328  1uF  Case/Package: 0402  Voltage Rating: 25V  [CAP 0402/1005 KK]
C329  1uF  Case/Package: 0402  Voltage Rating: 25V  [CAP 0402/1005 KK]
C330  100nF  Case/Package: 0402  Voltage Rating: 25V  [CAP 0402/1005 KK]
C333  10nF  [CAP 0201/0603 KK]
C336  100nF  Case Code (Imperial): 0402  Voltage: 50V  [CAP 0402/1005 KK]
C337  100nF  Case Code (Imperial): 0402  Voltage: 50V  [CAP 0402/1005 KK]
C338  100nF  Case Code (Imperial): 0402  Voltage: 50V  [CAP 0402/1005 KK]
C339  10uF  Case/Package: 0805  Voltage Rating: 25V  [CAP 0805/2012 RF]
C340  1uF  Case/Package: 0402  Voltage Rating: 25V  [CAP 0402/1005 KK]
C341  100nF  Case/Package: 0402  Voltage Rating: 25V  [CAP 0402/1005 KK]
C342  100nF  Case/Package: 0402  Voltage Rating: 25V  [CAP 0402/1005 KK]
C343  100nF  Case/Package: 0402  Voltage Rating: 25V  [CAP 0402/1005 KK]
C344  10nF  [CAP 0201/0603 KK]
C724  10nF  Voltage Rating (DC): 16V  [CAP 0201/0603 KK]
C725  10nF  Voltage Rating (DC): 16V  [CAP 0201/0603 KK]
C726  10nF  [CAP 0201/0603 KK]
C727  10nF  [CAP 0201/0603 KK]
FB23  Ferrite Chip  [FER 0603/1608]
FB24  Ferrite Chip  [FER 0603/1608]
J26  5-1814832-1  [TECO-5-1814832-1_V]
R100  5.1kR  [RES 0402/1005 RF KK]
R125  8.87kR  [RES 0402/1005 RF KK]
R245  100R  Case/Package: 0402  [RES 0402/1005 RF KK]
R246  120R  [RES 0402/1005 RF KK]
R247  127R  [RES 0402/1005 RF KK]
R248  127R  [RES 0402/1005 RF KK]
R249  120R  [RES 0402/1005 RF KK]
R250  82.5R  [RES 0402/1005 RF KK]
R251  82.5R  [RES 0402/1005 RF KK]
R252  1kR  [RES 0402/1005 RF KK]
R253  1kR  [RES 0402/1005 RF KK]
R254  1kR  [RES 0402/1005 RF KK]
R255  1kR  [RES 0402/1005 RF KK]
R256  120R  [RES 0402/1005 RF KK]
R257  49.9R  Case/Package: 0402  [RES 0402/1005 RF KK]
R258  120R  [RES 0402/1005 RF KK]
R259  82.5R  [RES 0402/1005 RF KK]
R260  82.5R  [RES 0402/1005 RF KK]
R261  127R  [RES 0402/1005 RF KK]
R262  127R  [RES 0402/1005 RF KK]
R263  60.4kR  [RES 0402/1005 RF KK]
R264  0mR  Case/Package: 0402  [RES 0402/1005 RF KK]
R265  0mR  Case/Package: 0402  [RES 0402/1005 RF KK]
R291  150R  Case/Package: 0402  [RES 0402/1005 RF KK]
R301  150R  Case/Package: 0402  [RES 0402/1005 RF KK]
R384  71.5R  [RES 0402/1005 RF KK]
R385  71.5R  [RES 0402/1005 RF KK]
R386  8.87kR  [RES 0402/1005 RF KK]
R387  5.1kR  [RES 0402/1005 RF KK]
R427  5.1kR  [RES 0402/1005 RF KK]
R482  150R  Case/Package: 0402  [RES 0402/1005 RF KK]
R483  150R  Case/Package: 0402  [RES 0402/1005 RF KK]
R484  71.5R  [RES 0402/1005 RF KK]
R485  71.5R  [RES 0402/1005 RF KK]
R486  8.87kR  [RES 0402/1005 RF KK]
R487  5.1kR  [RES 0402/1005 RF KK]
R488  1kR  [RES 0402/1005 RF KK]
R489  100R  Case/Package: 0402  [RES 0402/1005 RF KK]
R537  0mR  Case/Package: 0402  [RES 0402/1005 RF KK]
R538  8.87kR  [RES 0402/1005 RF KK]
T36  SI2342DS-T1-GE3  Supplier Part Number 1: SI2342DS-T1-GE3CT-ND  [SI2342DS-T1-GE3]
U31  SI53323-B-GM  Supplier Part Number 1: 336-2500-5-ND  [SI53323-B-GM]
U32  SI53323-B-GM  Supplier Part Number 1: 336-2500-5-ND  [SI53323-B-GM]
U33  CDCM1802RGTT  Supplier Part Number 1: 296-17045-1-ND  [CDCM1802RGTT]

### Ports
CLK2_to_Check (harness Diff_1Pair), CLK_to_Check (harness Diff_1Pair), Ground, Osc_in, Power, REF (harness Diff_1Pair), Sel_CLK

### Harnesses
Diff_1Pair: P, N
Diff_1Pair: N, P

### Nets
CLK_M_OSC_In: C53.2 R257.2 R537.1 U33.2(IN)
Gnd_CLK_Mux: C53.1 C324.1 C326.2 C327.2 C328.2 C329.2 C336.1 C337.1 C338.1 C339.1 C340.2 C344.1 J26.2 J26.3 J26.4 J26.5 R100.1 R246.1 R247.1 R248.1 R249.2 R254.1 R255.1 R256.1 R258.2 R261.1 R262.1 R263.1 R264.1 R265.1 R291.2 R301.2 R387.1 R427.1 R482.2 R483.2 R487.1 T36.2(S) U31.1(GND) U31.2(CLK_SEL) U31.17(EPAD) U32.1(GND) U32.17(EPAD) U33.5(VSS) U33.6(VSS) U33.14(VSS) U33.17(EPAD) ; port Ground  [project net AGND]
OSC_500Out: C333.1 ; port Osc_in
Osc_in_Si53323_2_N: C343.1 R259.2 R261.2 R489.2 U32.6(CLK0)
Osc_in_Si53323_2_P: C342.1 R260.2 R262.2 R489.1 U32.7(CLK0b)
OSC_Out_DIV_N: C343.2 R258.1 U33.11(~{Y0})
OSC_Out_DIV_P: C342.2 R256.2 U33.10(Y0)
RefClk_Si53323_N: R253.1 R255.2 U31.7(CLK0b)
RefClk_Si53323_P: C341.1 R252.1 R254.2 U31.6(CLK0)
SetClk_Si53323_2: T36.1(G) ; port Sel_CLK
Si53323_1_Q1_N: C330.2 R249.1 U31.9(Q0)
Si53323_1_Q1_P: C325.2 R246.2 U31.10(Q0b)
Si53323_1_Q2_C_N: C725.2 R385.1
Si53323_1_Q2_C_P: C724.2 R384.1
Si53323_1_Q2_LVDS_N: C725.1 R386.2 R387.2 ; port CLK_to_Check.N
Si53323_1_Q2_LVDS_P: C724.1 R100.2 R125.2 ; port CLK_to_Check.P
Si53323_1_Q2_N: R301.1 R385.2 U31.12(Q1b)
Si53323_1_Q2_P: R291.1 R384.2 U31.11(Q1)
Si53323_2_CLK1_N: C330.1 R245.1 R248.2 R251.2 U32.4(CLK1b)
Si53323_2_CLK1_P: C325.1 R245.2 R247.2 R250.2 U32.3(CLK1)
Si53323_2_Q1_N: U32.10(Q0b) ; port REF.N
Si53323_2_Q1_P: U32.9(Q0) ; port REF.P
Si53323_2_Q2_C_N: C727.2 R485.1
Si53323_2_Q2_C_P: C726.2 R484.1
Si53323_2_Q2_LVDS_N: C727.1 R486.2 R487.2 ; port CLK2_to_Check.N
Si53323_2_Q2_LVDS_P: C726.1 R427.2 R538.2 ; port CLK2_to_Check.P
Si53323_2_Q2_N: R483.1 R485.2 U32.11(Q1)
Si53323_2_Q2_P: R482.1 R484.2 U32.12(Q1b)
VBB: C344.2 R257.1 U33.3(~{IN}) U33.4(VBB)
Vcc_CLK_Mux: C324.2 C339.2 FB23.1 FB24.1 R252.2 R253.2 ; port Power  [project net 3V3_RAIL]
Vcc_CLK_Mux_Fine: C326.1 C327.1 C328.1 C329.1 FB23.2 R125.1 R250.1 R251.1 R259.1 R260.1 R386.1 R486.1 R488.2 R538.1 U31.5(VDD) U32.5(VDD)
VDD_CLK_MUX_DIV_3.3V: C336.2 C337.2 C338.2 C340.1 FB24.2 U33.1(Vdd_PECL) U33.8(VDD1) U33.9(VDD0) U33.12(VDD0)
NetC333_2: C333.2 R537.2
NetC341_2: C341.2 J26.1
NetR263_2: R263.2 U33.16(EN)
NetR264_2: R264.2 U33.13(S0)
NetR265_2: R265.2 U33.15(S1)
NetR488_1: R488.1 T36.3(D) U32.2(CLK_SEL)

Not connected (* = marked no-connect by the designer): U31 3(CLK1)* 4(CLK1b)* 8(NC)* 13(Q2)* 14(Q2b)* 15(Q3)* 16(Q3b)*; U32 8(NC)* 13(Q2)* 14(Q2b)* 15(Q3)* 16(Q3b)*; U33 7(Y1)

### Layout directives
differential pair; differential pair class Diff_100: Osc_in_Si53323_2_N, Osc_in_Si53323_2_P, OSC_Out_DIV_N, OSC_Out_DIV_P, RefClk_Si53323_N, RefClk_Si53323_P, Si53323_1_Q1_N, Si53323_1_Q1_P, Si53323_1_Q2_C_N, Si53323_1_Q2_C_P, Si53323_1_Q2_LVDS_N, Si53323_1_Q2_LVDS_P, Si53323_1_Q2_N, Si53323_1_Q2_P, Si53323_2_CLK1_N, Si53323_2_CLK1_P, Si53323_2_Q1_N, Si53323_2_Q1_P, Si53323_2_Q2_C_N, Si53323_2_Q2_C_P, Si53323_2_Q2_LVDS_N, Si53323_2_Q2_LVDS_P, Si53323_2_Q2_N, Si53323_2_Q2_P
net class MUX_DIV_OUT_I: Osc_in_Si53323_2_N, Osc_in_Si53323_2_P
net class CLM_M_OSC_IN_C: OSC_500Out
net class Si53323_2_Q1: Si53323_2_Q1_N, Si53323_2_Q1_P
net class Si53323_2_Q2: Si53323_2_Q2_N, Si53323_2_Q2_P
net class Si53323_1_Q1: Si53323_1_Q1_N, Si53323_1_Q1_P
net class Si53323_1_Q2: Si53323_1_Q2_N
net class CLK_M_OSC_In: CLK_M_OSC_In
net class Single_50: CLK_M_OSC_In, NetC333_2, NetC341_2, OSC_500Out, Osc_in_Si53323_2_N, Osc_in_Si53323_2_P, OSC_Out_DIV_N, OSC_Out_DIV_P, RefClk_Si53323_N, RefClk_Si53323_P, Si53323_1_Q1_N, Si53323_1_Q1_P, Si53323_1_Q2_C_N, Si53323_1_Q2_C_P, Si53323_1_Q2_LVDS_N, Si53323_1_Q2_LVDS_P, Si53323_1_Q2_N, Si53323_2_CLK1_N, Si53323_2_Q1_N, Si53323_2_Q1_P, Si53323_2_Q2_C_N, Si53323_2_Q2_C_P, Si53323_2_Q2_LVDS_N, Si53323_2_Q2_LVDS_P, Si53323_2_Q2_N, Si53323_2_Q2_P
net class MUX_DIV_OUT: OSC_Out_DIV_N, OSC_Out_DIV_P
net class Si53323_2_CLK1: Si53323_2_CLK1_N
net class RefClk_Si53323: RefClk_Si53323_N, RefClk_Si53323_P
net class Si53323_1_Q2_LVDS: Si53323_1_Q2_LVDS_N, Si53323_1_Q2_LVDS_P
net class Si53323_2_Q2_LVDS: Si53323_2_Q2_LVDS_N, Si53323_2_Q2_LVDS_P
net class Si53323_1_Q2_C: Si53323_1_Q2_C_N, Si53323_1_Q2_C_P
net class Si53323_2_Q2_C: Si53323_2_Q2_C_N, Si53323_2_Q2_C_P

### Notes on the sheet
- zasada działania: praca z OSC_in z mozliwośćią sprawdzania sygnału REfSignal
- Uwagi OSC_in_SI53324_P --> nazwa myląca nie mamy układu SI53324 - Poprawione
- Jeżeli jest refsignal, należy go użyć
- (near R100) DNP
- LVPCEL--->LVDS
- max 100mA
- (near U32) świadome odwrócenie zegara o 180°
- (near R485) Zamieniona polaryzacja
- (near R265) Mode 4 dzielnik /2 S0-DNF
- *Note: Unused outputs can be left floating. Do not short unused outputs to ground. Strona 5 <https://datasheet.ciiva.com/24019/si53323-258666-24019274.pdf?src-supplier=Mouser>
- Title
- Size:
- Date:
- A3
- Number:
- Time:
- Revision:
- Sheet
- of
- File: